# Altium schematic sheet GSM-USB-HUB-Sheet.SchDoc (part 1 of 3)
size 420 x 297 mm; SheetNumber: 4; SheetTotal: 5
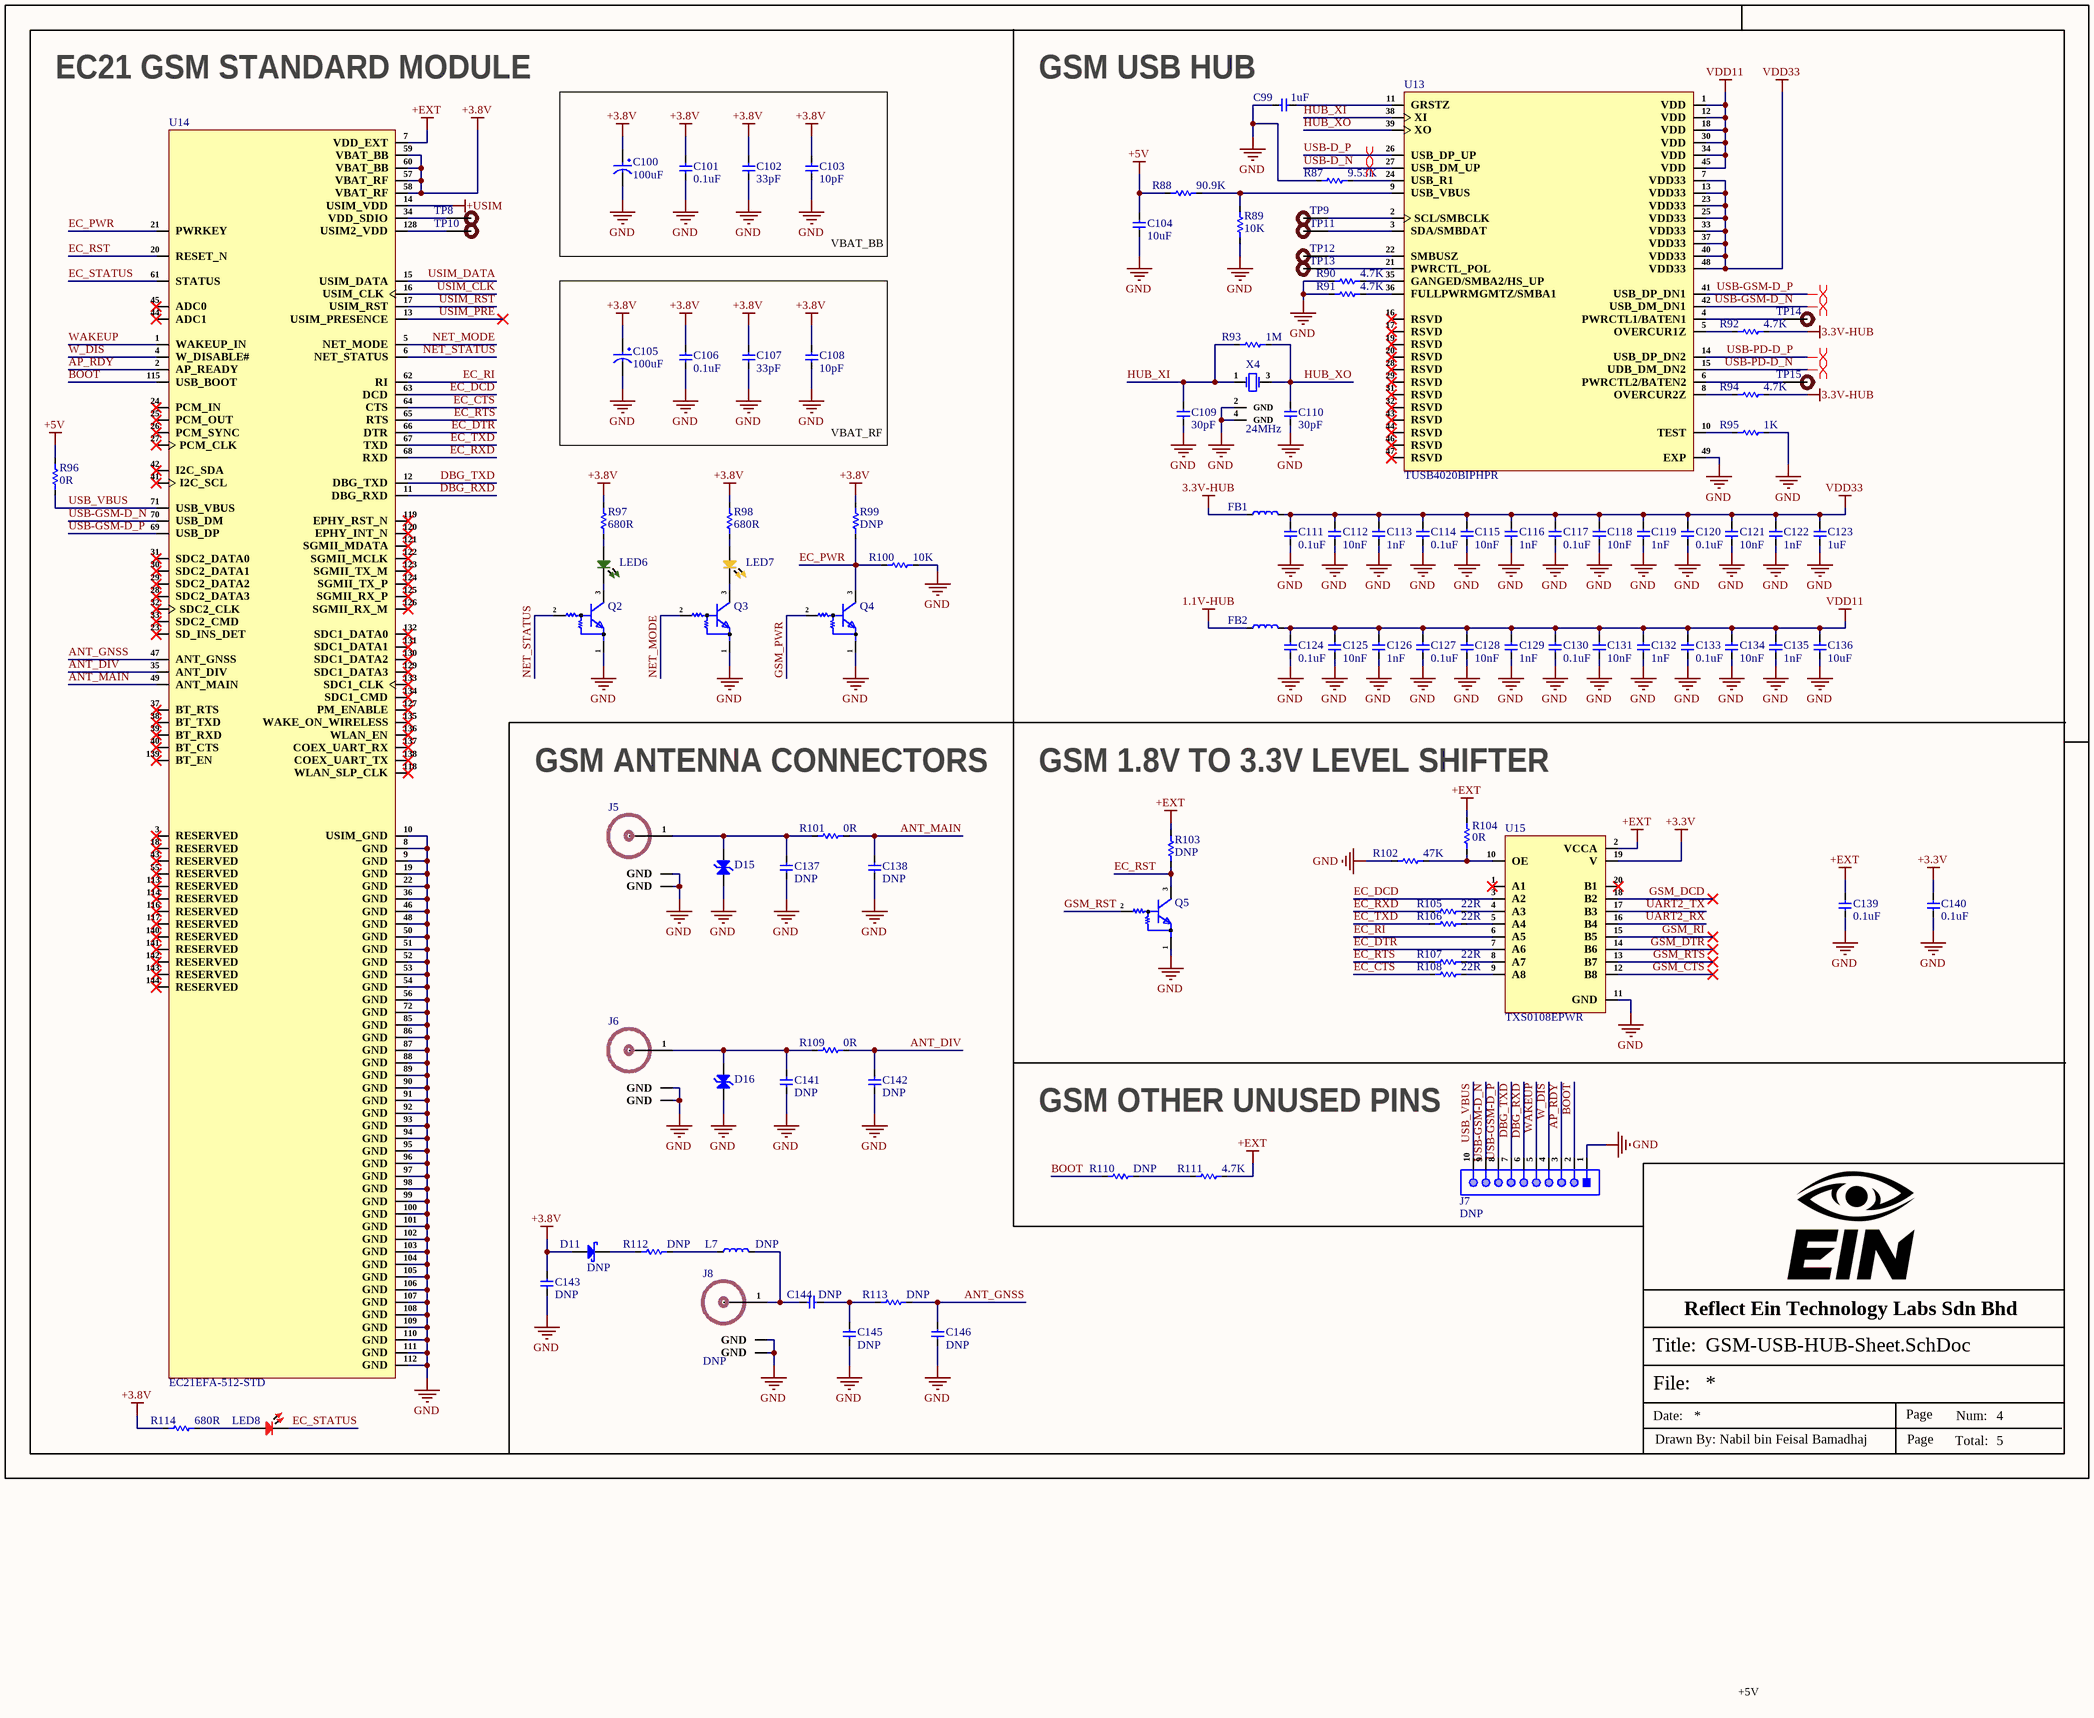
[diagram p0: GSM-USB-HUB-Sheet.SchDoc]

## Parts
C99  1uF  [Cap-0603]
C100  100uF  [Case-A]
C101  0.1uF  [Cap-0603]
C102  33pF  [Cap-0603]
C103  10pF  [Cap-0603]
C104  10uF  [Cap-1210]
C105  100uF  [Case-A]
C106  0.1uF  [Cap-0603]
C107  33pF  [Cap-0603]
C108  10pF  [Cap-0603]
C109  30pF  [Cap-0603]
C110  30pF  [Cap-0603]
C111  0.1uF  [Cap-0402]
C112  10nF  [Cap-0402]
C113  1nF  [Cap-0402]
C114  0.1uF  [Cap-0402]
C115  10nF  [Cap-0402]
C116  1nF  [Cap-0402]
C117  0.1uF  [Cap-0402]
C118  10nF  [Cap-0402]
C119  1nF  [Cap-0402]
C120  0.1uF  [Cap-0402]
C121  10nF  [Cap-0402]
C122  1nF  [Cap-0402]
C123  1uF  [Cap-0402]
C124  0.1uF  [Cap-0402]
C125  10nF  [Cap-0402]
C126  1nF  [Cap-0402]
C127  0.1uF  [Cap-0402]
C128  10nF  [Cap-0402]
C129  1nF  [Cap-0402]
C130  0.1uF  [Cap-0402]
C131  10nF  [Cap-0402]
C132  1nF  [Cap-0402]
C133  0.1uF  [Cap-0402]
C134  10nF  [Cap-0402]
C135  1nF  [Cap-0402]
C136  10uF  [Cap-0402]
C137  DNP  [Cap-0402]
C138  DNP  [Cap-0402]
C139  0.1uF  [Cap-0603]
C140  0.1uF  [Cap-0603]
C141  DNP  [Cap-0402]
C142  DNP  [Cap-0402]
C143  DNP  [Cap-0603]
C144  DNP  [Cap-0402]
C145  DNP  [Cap-0402]
C146  DNP  [Cap-0402]
D11  DNP  [SOD-123]
D15  TPD1E0B04DPYR  [2-X1SON (1x.60)]  (value not drawn)
D16  TPD1E0B04DPYR  [2-X1SON (1x.60)]  (value not drawn)
FB1  BLM18PG221SN1D  [IND-0603 (1608 Metric)]  (value not drawn)
FB2  BLM18PG221SN1D  [IND-0603 (1608 Metric)]  (value not drawn)
J5  U.FL-R-SMT(10)  [U.FL-R-SMT(10)]  (value not drawn)
J6  U.FL-R-SMT(10)  [U.FL-R-SMT(10)]  (value not drawn)
J7  DNP  [HDR 1X10 male]
J8  DNP  [U.FL-R-SMT(10)]
L7  DNP  [IND-0603 (1608 Metric)]
LED6  GREEN  [TH LED 5mm Green]  (value not drawn)
LED7  YELLOW  [TH LED 5mm Yellow]  (value not drawn)
LED8  RED  [LED-0603]  (value not drawn)
Q2  DTC143ZETL  [SOT-416]  (value not drawn)
Q3  DTC143ZETL  [SOT-416]  (value not drawn)
Q4  DTC143ZETL  [SOT-416]  (value not drawn)
Q5  DTC143ZETL  [SOT-416]  (value not drawn)
R87  9.53K  [Res-0402]
R88  90.9K  [Res-0603]
R89  10K  [Res-0603]
R90  4.7K  [Res-0402]
R91  4.7K  [Res-0402]
R92  4.7K  [Res-0402]
R93  1M  [Res-0603]
R94  4.7K  [Res-0402]
R95  1K  [Res-0603]
R96  0R  [Res-0402]
R97  680R  [Res-0603]
R98  680R  [Res-0603]
R99  DNP  [Res-0603]
R100  10K  [Res-0603]
R101  0R  [Res-0402]
R102  47K  [Res-0603]
R103  DNP  [Res-0603]
R104  0R  [Res-0603]
R105  22R  [Res-0603]
R106  22R  [Res-0603]
R107  22R  [Res-0603]
R108  22R  [Res-0603]
R109  0R  [Res-0402]
R110  DNP  [Res-0603]
R111  4.7K  [Res-0603]
R112  DNP  [Res-0603]
R113  DNP  [Res-0402]
R114  680R  [Res-0603]
TP8  TEST POINT 0.5mm Dia  [Test-point - 0.5mm]  (value not drawn)  (no BOM)
TP9  TEST POINT 0.5mm Dia  [Test-point - 0.5mm]  (value not drawn)  (no BOM)
TP10  TEST POINT 0.5mm Dia  [Test-point - 0.5mm]  (value not drawn)  (no BOM)
TP11  TEST POINT 0.5mm Dia  [Test-point - 0.5mm]  (value not drawn)  (no BOM)
TP12  TEST POINT 0.5mm Dia  [Test-point - 0.5mm]  (value not drawn)  (no BOM)
TP13  TEST POINT 0.5mm Dia  [Test-point - 0.5mm]  (value not drawn)  (no BOM)
TP14  TEST POINT 0.5mm Dia  [Test-point - 0.5mm]  (value not drawn)  (no BOM)
TP15  TEST POINT 0.5mm Dia  [Test-point - 0.5mm]  (value not drawn)  (no BOM)
U13  TUSB4020BIPHPR  [48-HTQFP (7x7)]
U14  EC21EFA-512-STD  [EC21EFA-512-STD]
U15  TXS0108EPWR  [TSSOP-20]
X4  24MHz  [SMD5032-4P]

## Blocks framed on the sheet
VBAT_BB: C100-C103
VBAT_RF: C105-C108

## Nets
1.1V-HUB: FB2.1
3.3V-HUB: FB1.1 R92.2 R94.2
+3.3V: C140.2 U15.19(V)
+3.8V: C100.1 C101.2 C102.2 C103.2 C105.1 C106.2 C107.2 C108.2 C143.2 D11.1(A) R97.2 R98.2 R99.2 R114.2 U14.57(VBAT_RF) U14.58(VBAT_RF) U14.59(VBAT_BB) U14.60(VBAT_BB)
+5V: C104.2 R88.1 R96.2
+EXT: C139.2 R103.2 R104.2 R111.2 U14.7(VDD_EXT) U15.2(VCCA)
+USIM: U14.14(USIM_VDD)
GND: C99.1 C100.2 C101.1 C102.1 C103.1 C104.1 C105.2 C106.1 C107.1 C108.1 C109.1 C110.1 C111.1 C112.1 C113.1 C114.1 C115.1 C116.1 C117.1 C118.1 C119.1 C120.1 C121.1 C122.1 C123.1 C124.1 C125.1 C126.1 C127.1 C128.1 C129.1 C130.1 C131.1 C132.1 C133.1 C134.1 C135.1 C136.1 C137.1 C138.1 C139.1 C140.1 C141.1 C142.1 C143.1 C145.1 C146.1 D15.2(A) D16.2(A) J5.2(GND) J5.3(GND) J6.2(GND) J6.3(GND) J7.1 J8.2(GND) J8.3(GND) Q2.1(E) Q3.1(E) Q4.1(E) Q5.1(E) R87.1 R89.1 R90.1 R91.1 R95.1 R100.2 R102.2 U13.49(EXP) U14.8(GND) U14.9(GND) U14.10(USIM_GND) U14.19(GND) U14.22(GND) U14.36(GND) U14.46(GND) U14.48(GND) U14.50(GND) U14.51(GND) U14.52(GND) U14.53(GND) U14.54(GND) U14.56(GND) U14.72(GND) U14.85(GND) U14.86(GND) U14.87(GND) U14.88(GND) U14.89(GND) U14.90(GND) U14.91(GND) U14.92(GND) U14.93(GND) U14.94(GND) U14.95(GND) U14.96(GND) U14.97(GND) U14.98(GND) U14.99(GND) U14.100(GND) U14.101(GND) U14.102(GND) U14.103(GND) U14.104(GND) U14.105(GND) U14.106(GND) U14.107(GND) U14.108(GND) U14.109(GND) U14.110(GND) U14.111(GND) U14.112(GND) U15.11(GND) X4.2(GND) X4.4(GND)
VDD11: C124.2 C125.2 C126.2 C127.2 C128.2 C129.2 C130.2 C131.2 C132.2 C133.2 C134.2 C135.2 C136.2 FB2.2 U13.1(VDD) U13.12(VDD) U13.18(VDD) U13.30(VDD) U13.34(VDD) U13.45(VDD)
VDD33: C111.2 C112.2 C113.2 C114.2 C115.2 C116.2 C117.2 C118.2 C119.2 C120.2 C121.2 C122.2 C123.2 FB1.2 U13.7(VDD33) U13.13(VDD33) U13.23(VDD33) U13.25(VDD33) U13.33(VDD33) U13.37(VDD33) U13.40(VDD33) U13.48(VDD33)
ANT_DIV: C142.2 R109.2 U14.35(ANT_DIV)
ANT_GNSS: C146.2 R113.2 U14.47(ANT_GNSS)
ANT_MAIN: C138.2 R101.2 U14.49(ANT_MAIN)
AP_RDY: J7.3 U14.2(AP_READY)
BOOT: J7.2 R110.1 U14.115(USB_BOOT)
DBG_RXD: J7.6 U14.11(DBG_RXD)
DBG_TXD: J7.7 U14.12(DBG_TXD)
EC_CTS: R108.1 U14.64(CTS)
EC_DCD: U14.63(DCD) U15.3(A2)
EC_DTR: U14.66(DTR) U15.7(A6)
EC_PWR: Q4.3(C) R99.1 R100.1 U14.21(PWRKEY)
EC_RI: U14.62(RI) U15.6(A5)
EC_RST: Q5.3(C) R103.1 U14.20(RESET_N)
EC_RTS: R107.1 U14.65(RTS)
EC_RXD: R105.1 U14.68(RXD)
EC_STATUS: LED8.2 U14.61(STATUS)
EC_TXD: R106.1 U14.67(TXD)
GSM_CTS: U15.12(B8)
GSM_DCD: U15.18(B2)
GSM_DTR: U15.14(B6)
GSM_PWR: Q4.2(B)
GSM_RI: U15.15(B5)
GSM_RST: Q5.2(B)
GSM_RTS: U15.13(B7)
HUB_XI: C109.2 R93.1 U13.38(XI) X4.1(CRYSTAL)
HUB_XO: C110.2 R93.2 U13.39(XO) X4.3(CRYSTAL)
NET_MODE: Q3.2(B) U14.5(NET_MODE)
NET_STATUS: Q2.2(B) U14.6(NET_STATUS)
UART2_RX: U15.16(B4)
UART2_TX: U15.17(B3)
USB-D_N: U13.27(USB_DM_UP)
USB-D_P: U13.26(USB_DP_UP)
USB-GSM-D_N: J7.9 U13.42(USB_DM_DN1) U14.70(USB_DM)
USB-GSM-D_P: J7.8 U13.41(USB_DP_DN1) U14.69(USB_DP)
USB-PD-D_N: U13.15(UDB_DM_DN2)
USB-PD-D_P: U13.14(USB_DP_DN2)
USB_VBUS: J7.10 R96.1 U14.71(USB_VBUS)
USIM_CLK: U14.16(USIM_CLK)
USIM_DATA: U14.15(USIM_DATA)
USIM_PRE: U14.13(USIM_PRESENCE)
USIM_RST: U14.17(USIM_RST)
W_DIS: J7.4 U14.4(W_DISABLE#)
WAKEUP: J7.5 U14.1(WAKEUP_IN)
NetC99_2: C99.2 U13.11(GRSTZ)
NetC137_2: C137.2 D15.1(K) J5.1(RF_IN) R101.1
NetC141_2: C141.2 D16.1(K) J6.1(RF_IN) R109.1
NetC144_1: C144.1 C145.2 R113.1
NetC144_2: C144.2 J8.1(RF_IN) L7.2
NetD11_2: D11.2(K) R112.1
NetL7_1: L7.1 R112.2
NetLED6_1: LED6.1 Q2.3(C)
NetLED6_2: LED6.2 R97.1
NetLED7_1: LED7.1 Q3.3(C)
NetLED7_2: LED7.2 R98.1
NetLED8_1: LED8.1 R114.1
NetR87_2: R87.2 U13.24(USB_R1)
NetR88_2: R88.2 R89.2 U13.9(USB_VBUS)
NetR90_2: R90.2 U13.35(GANGED/SMBA2/HS_UP)
NetR91_2: R91.2 U13.36(FULLPWRMGMTZ/SMBA1)
NetR92_1: R92.1 U13.5(OVERCUR1Z)
NetR94_1: R94.1 U13.8(OVERCUR2Z)
NetR95_2: R95.2 U13.10(TEST)
NetR102_1: R102.1 R104.1 U15.10(OE)
NetR105_2: R105.2 U15.4(A3)
NetR106_2: R106.2 U15.5(A4)
NetR107_2: R107.2 U15.8(A7)
NetR108_2: R108.2 U15.9(A8)
NetR110_2: R110.2 R111.1
NetTP8_1: TP8.1 U14.34(VDD_SDIO)
NetTP9_1: TP9.1 U13.2(SCL/SMBCLK)
NetTP10_1: TP10.1 U14.128(USIM2_VDD)
NetTP11_1: TP11.1 U13.3(SDA/SMBDAT)
NetTP12_1: TP12.1 U13.22(SMBUSZ)
NetTP13_1: TP13.1 U13.21(PWRCTL_POL)
NetTP14_1: TP14.1 U13.4(PWRCTL1/BATEN1)
NetTP15_1: TP15.1 U13.6(PWRCTL2/BATEN2)

Not connected (* = marked no-connect by the designer): U13 16(RSVD)* 17(RSVD)* 19(RSVD)* 20(RSVD)* 28(RSVD)* 29(RSVD)* 31(RSVD)* 32(RSVD)* 43(RSVD)* 44(RSVD)* 46(RSVD)* 47(RSVD)*; U14 3(RESERVED)* 18(RESERVED)* 23(SD_INS_DET)* 24(PCM_IN)* 25(PCM_OUT)* 26(PCM_SYNC)* 27(PCM_CLK)* 28(SDC2_DATA3)* 29(SDC2_DATA2)* 30(SDC2_DATA1)* 31(SDC2_DATA0)* 32(SDC2_CLK)* 33(SDC2_CMD)* 37(BT_RTS)* 38(BT_TXD)* 39(BT_RXD)* 40(BT_CTS)* 41(I2C_SCL)* 42(I2C_SDA)* 43(RESERVED)* 44(ADC1)* 45(ADC0)* 55(RESERVED)* 113(RESERVED)* 114(RESERVED)* 116(RESERVED)* 117(RESERVED)* 118(WLAN_SLP_CLK)* 119(EPHY_RST_N)* 120(EPHY_INT_N)* 121(SGMII_MDATA)* 122(SGMII_MCLK)* 123(SGMII_TX_M)* 124(SGMII_TX_P)* 125(SGMII_RX_P)* 126(SGMII_RX_M)* 127(PM_ENABLE)* 129(SDC1_DATA3)* 130(SDC1_DATA2)* 131(SDC1_DATA1)* 132(SDC1_DATA0)* 133(SDC1_CLK)* 134(SDC1_CMD)* 135(WAKE_ON_WIRELESS)* 136(WLAN_EN)* 137(COEX_UART_RX)* 138(COEX_UART_TX)* 139(BT_EN)* 140(RESERVED)* 141(RESERVED)* 142(RESERVED)* 143(RESERVED)* 144(RESERVED)*; U15 1(A1)* 20(B1)*

## Layout directives
differential pair; differential pair class DIFF_USB: USB-D_N, USB-D_P, USB-GSM-D_N, USB-GSM-D_P, USB-PD-D_N, USB-PD-D_P

## Notes on the sheet
- EC21 GSM STANDARD MODULE
- GSM USB HUB
- GSM ANTENNA CONNECTORS
- GSM 1.8V TO 3.3V LEVEL SHIFTER
- GSM OTHER UNUSED PINS
- +5V
- Reflect Ein Technology Labs Sdn Bhd
- File:
- Title:
- Date:
- Page
- Num:
- Total:
- Drawn By: Nabil bin Feisal Bamadhaj